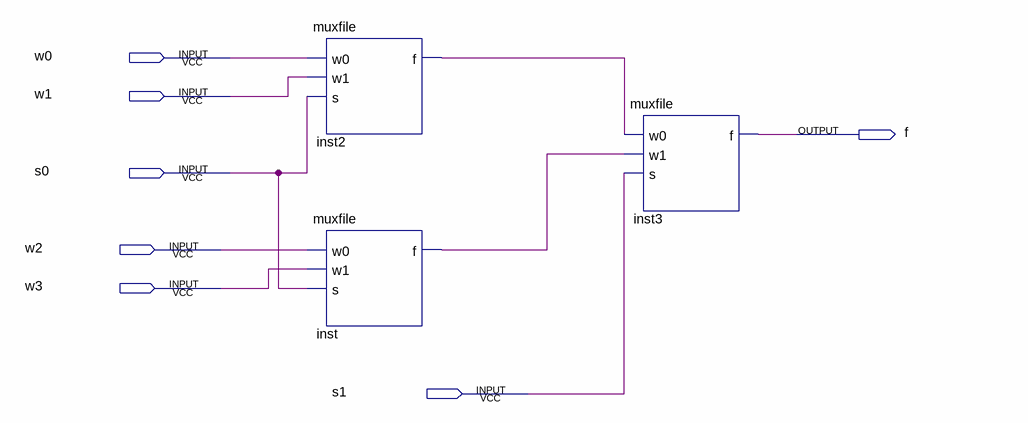
[diagram p0: schematic sheet]
// Quartus schematic muxModified.bdf as structural Verilog: 3 symbols, 7 pins
module muxModified (
  input  w0,
  input  w1,
  input  s0,
  input  w2,
  input  w3,
  input  s1,
  output f
);

  wire inst2_f, inst_f;

  muxfile inst2 (.w0(w0), .w1(w1), .s(s0), .f(inst2_f));
  muxfile inst (.w0(w2), .w1(w3), .s(s0), .f(inst_f));
  muxfile inst3 (.w0(inst2_f), .w1(inst_f), .s(s1), .f(f));
endmodule
